# Altium schematic sheet PiggySat-power.SchDoc: PiggySat-power
size A4; DocumentNumber: 003; Revision: 1.0; SheetNumber: 2; SheetTotal: 2
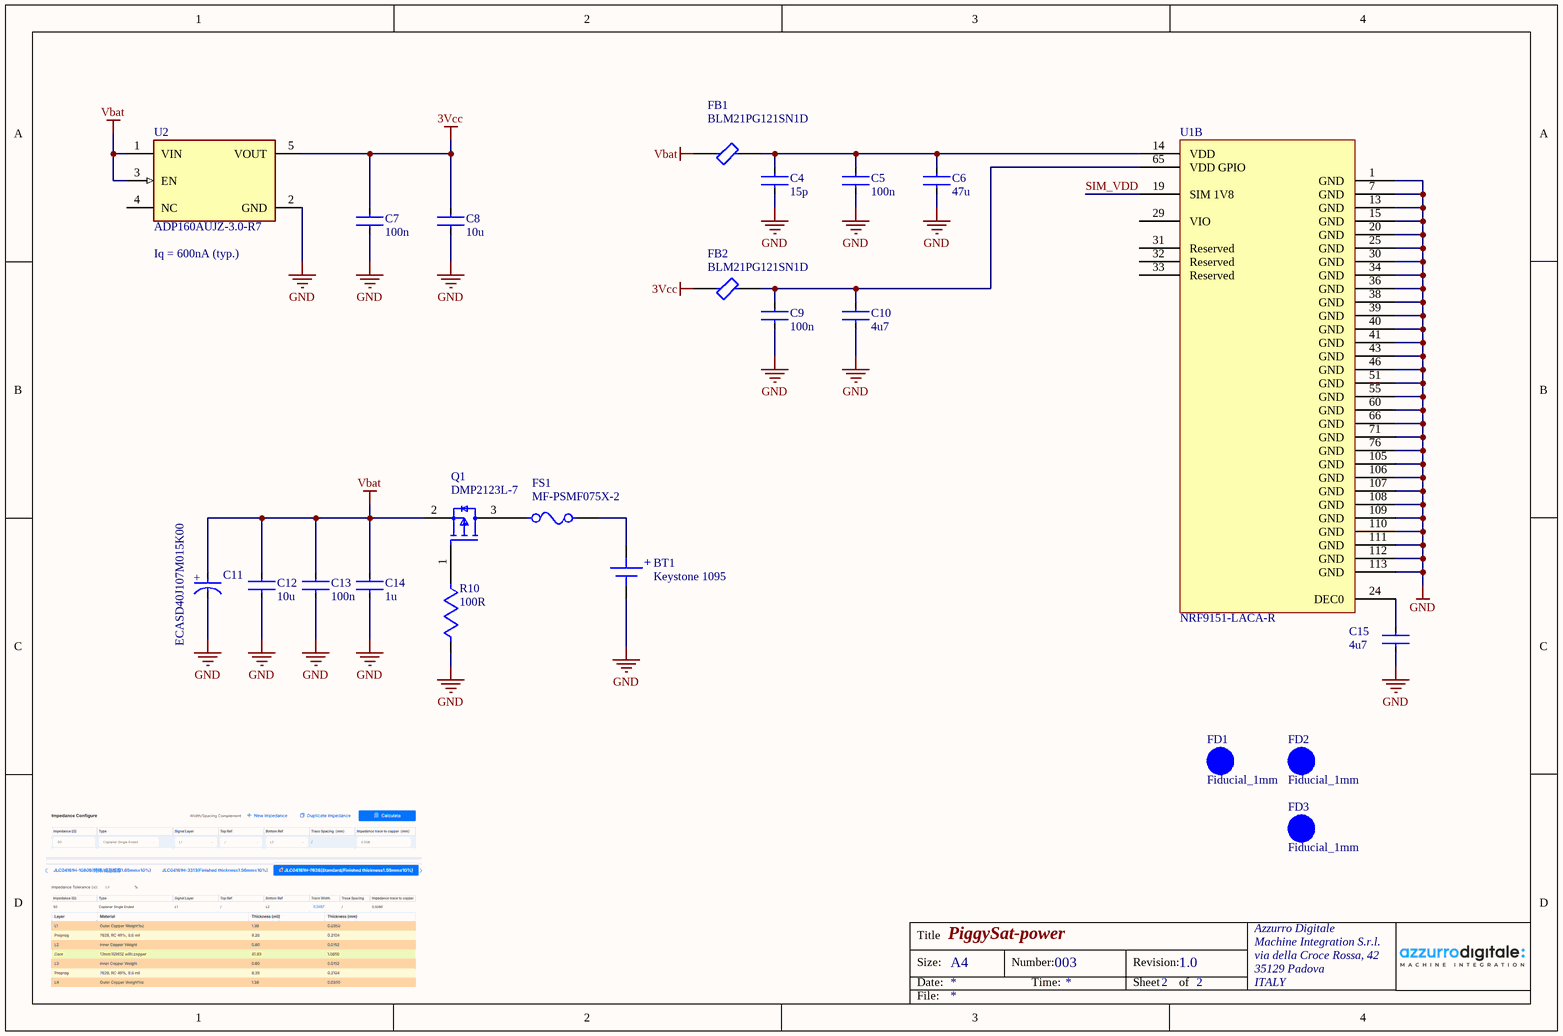
[diagram p0: PiggySat-power.SchDoc]

## Parts
BT1  Keystone 1095  [KEYSTONE 1095]
C4  15p  [CAPC1608X06L]
C5  100n  [CAPC1608X06L]
C6  47u  [CAPC2012X11L]
C7  100n  [CAPC1608X06L]
C8  10u  [CAPC1608X06L]
C9  100n  [CAPC1608X06L]
C10  4u7  [CAPC1608X06L]
C11  ECASD40J107M015K00  [FP-ECAS-D4-MFG]
C12  10u  [CAPC1608X06L]
C13  100n  [CAPC1608X06L]
C14  1u  [CAPC1608X06L]
C15  4u7  [CAPC1608X06L]
FB1  BLM21PG121SN1D  [FP-BLM21-0_2-t0_85-e0_5-d-IPC_C]
FB2  BLM21PG121SN1D  [FP-BLM21-0_2-t0_85-e0_5-d-IPC_C]
FD1  Fiducial_1mm  [Fiducial_1mm-Footprint-1]  (no BOM)
FD2  Fiducial_1mm  [Fiducial_1mm-Footprint-1]  (no BOM)
FD3  Fiducial_1mm  [Fiducial_1mm-Footprint-1]  (no BOM)
FS1  MF-PSMF075X-2  [FP-MF-PSMF-MFG]
Q1  DMP2123L-7  [FP-SOT23-MFG]
R10  100R  [RESC1005X04L]
U1  NRF9151-LACA-R  [FP-nRF9151-LACA-R_MFG]  (part B of 2)
U2  ADP160AUJZ-3.0-R7  [FP-UJ-5-IPC_A]

## Nets
3Vcc: C7.2 C8.2 FB2.2 U2.5(VOUT)
GND: BT1.N C4.1 C5.1 C6.1 C7.1 C8.1 C9.1 C10.1 C11.1(C) C12.1 C13.1 C14.1 C15.1 R10.2 U1.1(GND) U1.7(GND) U1.13(GND) U1.15(GND) U1.20(GND) U1.25(GND) U1.30(GND) U1.34(GND) U1.36(GND) U1.38(GND) U1.39(GND) U1.40(GND) U1.41(GND) U1.43(GND) U1.46(GND) U1.51(GND) U1.55(GND) U1.60(GND) U1.66(GND) U1.71(GND) U1.76(GND) U1.105(GND) U1.106(GND) U1.107(GND) U1.108(GND) U1.109(GND) U1.110(GND) U1.111(GND) U1.112(GND) U1.113(GND) U2.2(GND)
Vbat: C11.2(A) C12.2 C13.2 C14.2 FB1.2 Q1.2(S) U2.1(VIN) U2.3(EN)
SIM_VDD: U1.19(SIM_1V8)
NetBT1_P: BT1.P FS1.2
NetC4_2: C4.2 C5.2 C6.2 FB1.1 U1.14(VDD)
NetC9_2: C9.2 C10.2 FB2.1 U1.65(VDD_GPIO)
NetC15_2: C15.2 U1.24(DEC0)
NetFS1_1: FS1.1 Q1.3(D)
NetQ1_1: Q1.1(G) R10.1

Not connected (* = marked no-connect by the designer): U1 29(VIO) 31(Reserved) 32(Reserved) 33(Reserved); U2 4(NC)

## Notes on the sheet
- (near U2) Iq = 600nA (typ.)
- Title
- Size:
- Date:
- A4
- Number:
- Time:
- Revision:
- Sheet
- of
- Azzurro Digitale
- Machine Integration S.r.l.
- via della Croce Rossa, 42
- 35129 Padova
- ITALY
- File:
- (in symbol CMP-06031-000020-2) +
- (in symbol Keystone 1095) +

## Library data of the parts
BT1 = Keystone 1095: THM Holder for 18350 Battery P/N 1095
C4 = CMP-001-00001-3: Cap 16V 15p X7R 0603 10%; Component Class: Capacitors
C5 C7 C9 C13 = CMP-001-00001-3: Cap 16V 100n X7R 0603 10%; Component Class: Capacitors
C6 = CMP-001-00002-1: Cap 16V 47u X7R 0603 10%
C8 C12 = CMP-001-00001-3: Cap 16V 10u X7R 0603 10%; Component Class: Capacitors
C10 C15 = CMP-001-00001-3: Cap 16V 4.7u X7R 0603 10%; Component Class: Capacitors
C11 = CMP-06031-000020-2: Polymer Aluminum Electrolytic Capacitor 2917 100uF±20% 6.3V 15mΩ; Resistance: 0.015R; Polarity: Polar; Tolerance: 20%; Ripple Current: 2A; Life (Hours): 1000Hour; ESR (Equivalent Series Resistance): 15mR; Capacitance: 100uF; Depth: 4.3mm; Package Quantity: 1; Max Operating Temperature: 105°C; Voltage Rating: 6.3V; Termination: SMD/SMT; Radiation Hardening: No; Mount: Surface Mount; Construction: Flat; Case/Package: 2917; Case Code (Imperial): 2917; Height - Seated (Max): 0.075inch; Length: 7.3mm; Packaging: Tape and Reel; Width: 0.169inch; Series: ECAS; Weight: 0.023634oz; Lead Free: Lead Free; Min Operating Temperature: -40°C; Voltage Rating (DC): 6.3V; Height: 1.9mm; Case Code (Metric): 7343; RoHS Compliant: Yes
C14 = CMP-001-00001-3: Cap 16V 1u X7R 0603 10%; Component Class: Capacitors
FB1 FB2 = CMP-0686-00612-3: Chip Ferrite Bead, 0805, 120Ω @ 100MHz, 0.03Ω, 25%, 3A; Impedance: 120R; Number of Circuits: 1; Material: Steel; DC Resistance (DCR): 30mR; Package Quantity: 1; Lead Free: Lead Free; Width: 1.25mm; Number of Pins: 2; Depth: 1.25mm; Case Code (Imperial): 0805; Tolerance: 25%; Current Rating: 3A; Test Frequency: 100MHz; Length: 2mm; Min Operating Temperature: -55°C; Max Current Rating: 3A; REACH SVHC: No SVHC; Series: BLM21P; Height: 0.85mm; Max DC Current: 3A; Termination: SMD/SMT; Max Operating Temperature: 125°C; Number of Lines: 1; Case/Package: 0805; RoHS Compliant: Yes; Packaging: Tape and Reel; Case Code (Metric): 2012; DC Resistance-Max: 30mR
FD1-FD3 = CMP-00017-7: 1mm fiducial marker
FS1 = CMP-07400-000017-1: PTC RESET FUSE 6V 750MA 0805; Manufacturer Part Number: MF-PSMF010X-2; Manufacturer: Bourns Inc.; Resistance: 1-7.5Ω; Value: 1-7.5Ω; Current Rating: 40A; Hold Current: 0.1A; Trip Current: 0.3A; Voltage Rating: 15V; Trip Time: 1.5s; Temperature: -40°C to +85°C; ComponentLink2Description: Datasheet; Lead Free: Yes; Ipc Land Pattern Name: CAPC215135X67; Device Class L1: Circuit Protection; Mouser Description: Resettable Fuses - PPTC 0.10A 15V 1ohm; Automotive: No; Octopart: https://octopart.com/mf-psmf010x-2-bourns-7483441; RoHS: TRUE; Temperature Range High: +85°C; Digikey Description: PTC RESET FUSE 15V 100MA 0805; Device Class L3: unset; ComponentLink2URL: https://www.bourns.com/docs/Product-Datasheets/mfpsmf.pdf; Height: 0.85mm; Ambient Temperature Range Low: -40°C; Category: Fuse; Package: MF-PSMF; Temperature Range Low: -40°C; Device Class L2: PTC Resettable Fuses; Ambient Temperature Range High: +85°C
Q1 = CMP-00461-12441635-1: DMP2123L-7 P-Channel 20 V 72 mO Surface Mount Enhancement Mode Mosfet - SOT-23; Number of Channels: 1; Power Dissipation: 1.4W; Gate to Source Voltage (Vgs): 12V; Rds On Max: 72mΩ; Drain to Source Breakdown Voltage: -20V; Turn-On Delay Time: 12ns; Turn-Off Delay Time: 38ns; Max Junction Temperature (Tj): 150°C; Element Configuration: Single; Drain to Source Resistance: 51mΩ; Continuous Drain Current (ID): -3A; Fall Time: 41ns; Rise Time: 20ns; Input Capacitance: 443pF; Weight: 7.994566mg; Number of Pins: 3; Schedule B: 8541290080, 8541290080; Max Power Dissipation: 1.4W; REACH SVHC: No SVHC; Mount: Surface Mount; Radiation Hardening: No; Max Operating Temperature: 150°C; Height: 1.1mm; NexarPartId: 12441635; Resistance: 72mΩ; Min Operating Temperature: -55°C; Lead Free: Lead Free; Width: 1.3mm; Drain to Source Voltage (Vdss): -20V; Case/Package: SOT-23-3; Length: 2.9mm; Number of Elements: 1; RoHS: Compliant
R10 = CMP-009-00001-2: Res 100R 0402
U1 = CMP-00045-6: Lower Power SIP for cellular IoT and DECT NR+, Compatible with nRF Cloud Services; Number of ADC Channels: 8; Interface: 2-Wire, I2C, I2S, SPI, UART, USB; Max Supply Voltage: 5.5V; Number of GPIO: 32; Data Rate: 3.4Mbps; Bandwidth: 1.5GHz; Min Supply Voltage: 1.7V; Clock Frequency: 2.2GHz; Min Operating Temperature: -40°C; Height: 1.3mm; Max Operating Temperature: 85°C; RoHS: Compliant; Ambient Temperature Range High: 85°C
U2 = CMP-09138-000096-1: IC REG LINEAR 3V 150MA TSOT5; Accuracy: 2%; Max Output Voltage: 4.2V; Number of Outputs: 1; Max Supply Current: 42uA; Min Current Limit: 220mA; Min Input Voltage: 2.2V; Dropout Voltage: 120mV; Power Supply Rejection Ratio (PSRR): 60dB; Output Type: Fixed; Min Output Voltage: 1.2V; Polarity: Positive; Quiescent Current: 0mA; Max Input Voltage: 5.5V; Min Operating Temperature: -40°C; Mount: Surface Mount; Length: 2.9mm; Series: -; Contact Plating: Tin; Packaging: Tape and Reel; Number of Pins: 5; Case/Package: TSOT; RoHS Compliant: Yes; Number of Regulators: 1; Nominal Supply Current: 42uA; Width: 1.6mm; Lead Free: Contains Lead; Max Output Current: 150mA; Output Voltage Accuracy: 2%; Height: 0.9mm; Output Voltage: 3V; Output Current: 150mA; Max Operating Temperature: 125°C; Operating Supply Current: 42uA